# Altium schematic sheet 00_Top.SchDoc
size A3; SheetNumber: 1; SheetTotal: 6
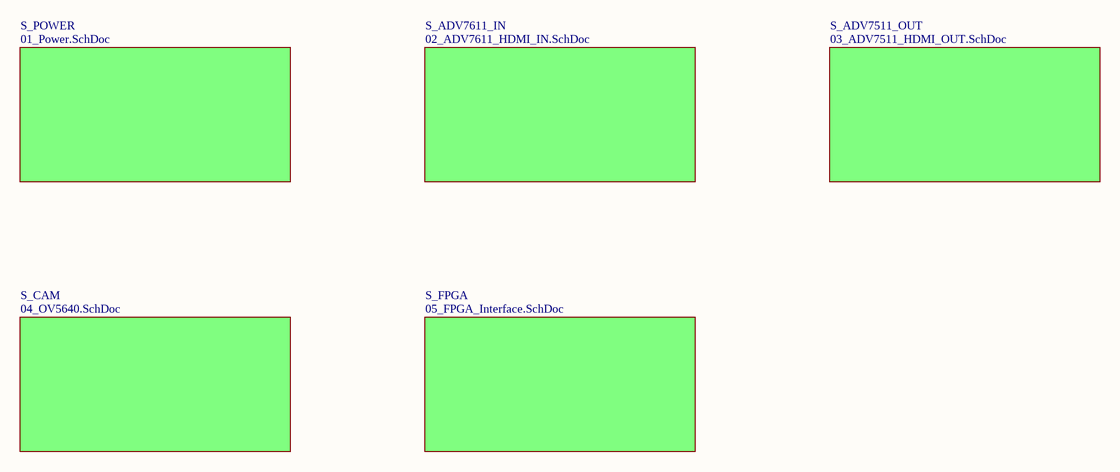
[diagram p0: 00_Top.SchDoc]

## Sub-sheets
S_ADV7511_OUT = 03_ADV7511_HDMI_OUT.SchDoc: no entries
S_ADV7611_IN = 02_ADV7611_HDMI_IN.SchDoc: no entries
S_CAM = 04_OV5640.SchDoc: no entries
S_FPGA = 05_FPGA_Interface.SchDoc: no entries
S_POWER = 01_Power.SchDoc: no entries